# Altium project OPTICAL-FLOW-STM32.PrjPcb
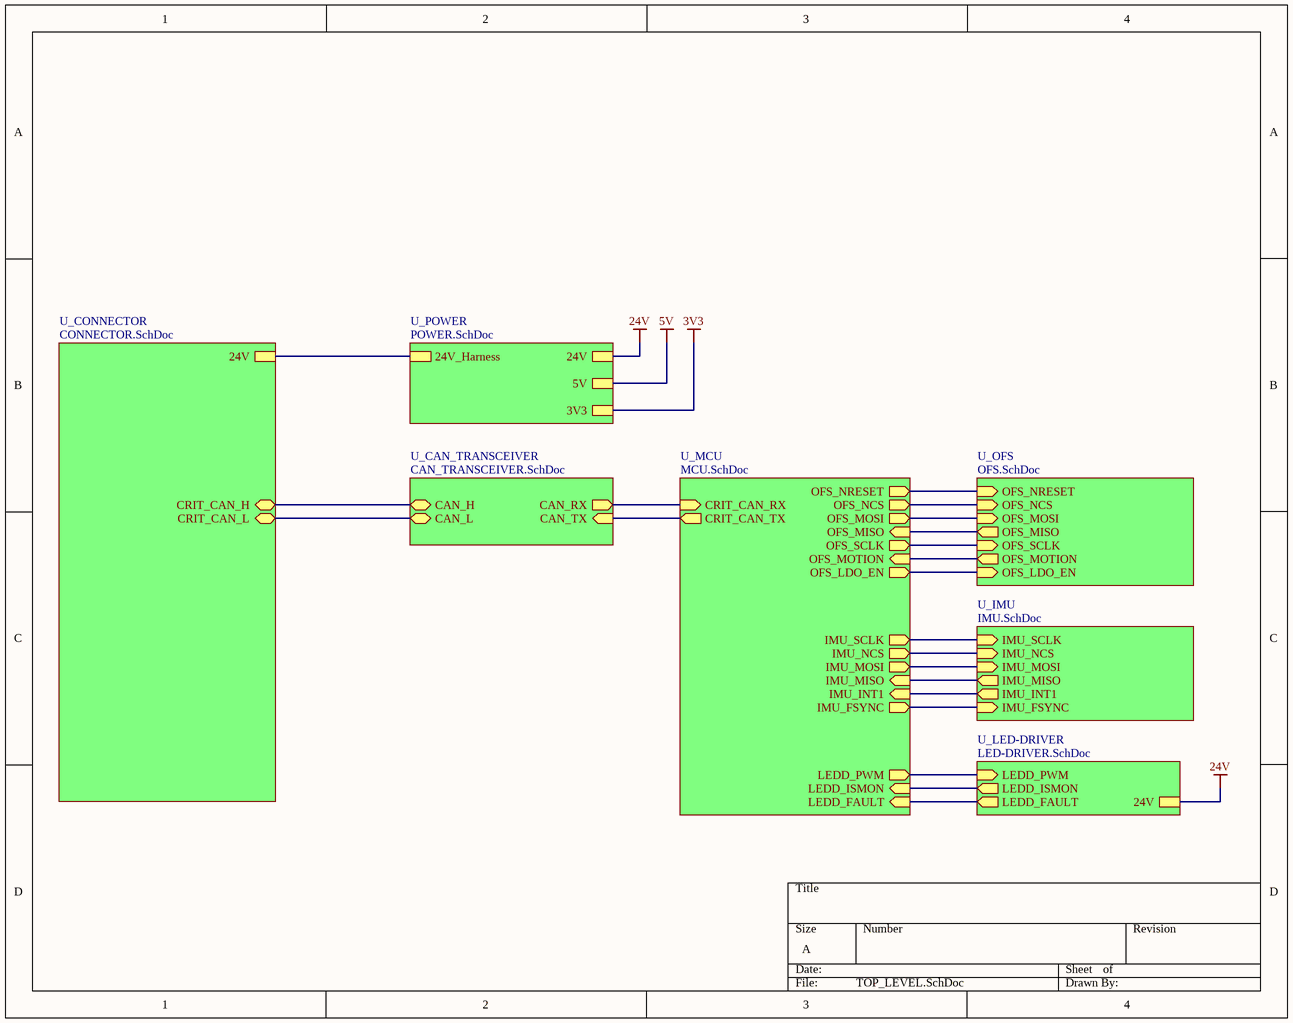
[diagram p0: TOP_LEVEL.SchDoc]
8 sheets, 89 parts. Net scope: hierarchical (ports join the sheet entries above them; power ports are global).
Board file: OFS_2027.PcbDoc
Sheets:
  TOP_LEVEL.SchDoc
    U_CAN_TRANSCEIVER = CAN_TRANSCEIVER.SchDoc
    U_POWER = POWER.SchDoc
    U_CONNECTOR = CONNECTOR.SchDoc
    U_MCU = MCU.SchDoc
    U_OFS = OFS.SchDoc
    U_IMU = IMU.SchDoc
    U_LED-DRIVER = LED-DRIVER.SchDoc

## Sheet TOP_LEVEL.SchDoc
size A; SheetNumber: 1; SheetTotal: 8

### Sub-sheets
U_CAN_TRANSCEIVER = CAN_TRANSCEIVER.SchDoc: CAN_TX (in), CAN_RX (out), CAN_L (bidir), CAN_H (bidir)
U_CONNECTOR = CONNECTOR.SchDoc: 24V, CRIT_CAN_L (bidir), CRIT_CAN_H (bidir)
U_IMU = IMU.SchDoc: IMU_SCLK (in), IMU_MOSI (in), IMU_MISO (out), IMU_INT1 (out), IMU_FSYNC (in), IMU_NCS (in)
U_LED-DRIVER = LED-DRIVER.SchDoc: LEDD_PWM (in), LEDD_ISMON (out), LEDD_FAULT (out), 24V
U_MCU = MCU.SchDoc: CRIT_CAN_RX (in), CRIT_CAN_TX (out), OFS_NRESET (out), OFS_NCS (out), OFS_MOSI (out), OFS_SCLK (out), OFS_MISO (in), OFS_MOTION (in), OFS_LDO_EN (out), IMU_SCLK (out), IMU_NCS (out), IMU_MOSI (out), IMU_MISO (in), IMU_INT1 (in), IMU_FSYNC (out), LEDD_PWM (out), LEDD_ISMON (in), LEDD_FAULT (in)
U_OFS = OFS.SchDoc: OFS_NRESET (in), OFS_NCS (in), OFS_MOSI (in), OFS_MOTION (out), OFS_LDO_EN (in), OFS_SCLK (in), OFS_MISO (out)
U_POWER = POWER.SchDoc: 24V, 24V_Harness, 5V, 3V3

### Nets
24V: sheet U_POWER/24V, sheet U_LED-DRIVER/24V
NetD3_2: sheet U_POWER/24V_Harness, sheet U_CONNECTOR/24V
NetR6_1: sheet U_MCU/OFS_MISO, sheet U_OFS/OFS_MISO
NetR7_2: sheet U_CAN_TRANSCEIVER/CAN_H, sheet U_CONNECTOR/CRIT_CAN_H
NetR8_1: sheet U_CAN_TRANSCEIVER/CAN_L, sheet U_CONNECTOR/CRIT_CAN_L
NetR?#6_1: sheet U_MCU/LEDD_PWM, sheet U_LED-DRIVER/LEDD_PWM
NetR?#8_1: sheet U_MCU/LEDD_FAULT, sheet U_LED-DRIVER/LEDD_FAULT
NetU1_4: sheet U_MCU/OFS_NCS, sheet U_OFS/OFS_NCS
NetU1_24: sheet U_MCU/LEDD_ISMON, sheet U_LED-DRIVER/LEDD_ISMON
NetU1_26: sheet U_MCU/OFS_MOTION, sheet U_OFS/OFS_MOTION
NetU1_27: sheet U_MCU/OFS_NRESET, sheet U_OFS/OFS_NRESET
NetU1_28: sheet U_MCU/OFS_LDO_EN, sheet U_OFS/OFS_LDO_EN
NetU1_29: sheet U_MCU/IMU_SCLK, sheet U_IMU/IMU_SCLK
NetU1_35: sheet U_MCU/IMU_MISO, sheet U_IMU/IMU_MISO
NetU1_36: sheet U_MCU/IMU_MOSI, sheet U_IMU/IMU_MOSI
NetU1_39: sheet U_MCU/IMU_FSYNC, sheet U_IMU/IMU_FSYNC
NetU1_44: sheet U_CAN_TRANSCEIVER/CAN_RX, sheet U_MCU/CRIT_CAN_RX
NetU1_45: sheet U_CAN_TRANSCEIVER/CAN_TX, sheet U_MCU/CRIT_CAN_TX
NetU1_51: sheet U_MCU/OFS_SCLK, sheet U_OFS/OFS_SCLK
NetU1_53: sheet U_MCU/OFS_MOSI, sheet U_OFS/OFS_MOSI
NetU1_55: sheet U_MCU/IMU_INT1, sheet U_IMU/IMU_INT1
NetU1_56: sheet U_MCU/IMU_NCS, sheet U_IMU/IMU_NCS

## Sheet CAN_TRANSCEIVER.SchDoc
size A; SheetNumber: 4; SheetTotal: 7
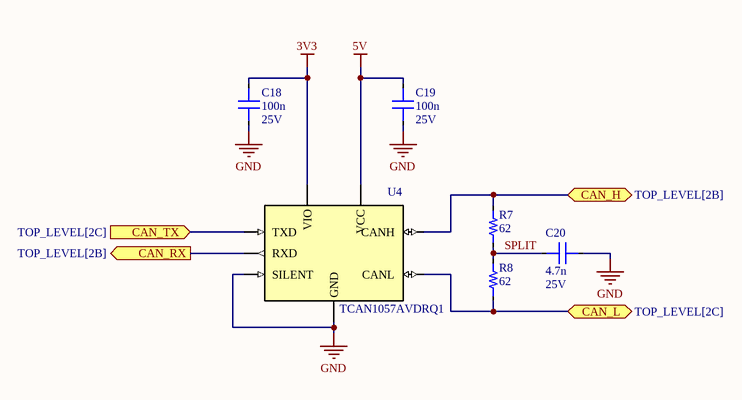
[diagram p1: CAN_TRANSCEIVER.SchDoc]

### Parts
C18  value 100n  Voltage: 25V  [0603_CAP]  (hidden comment: Capacitor)
C19  value 100n  Voltage: 25V  [0603_CAP]  (hidden comment: Capacitor)
C20  value 4.7n  Voltage: 25V  [0603_CAP]  (hidden comment: Capacitor)
R7  value 62  [0603_RES]  (hidden comment: Resistor)
R8  value 62  [0603_RES]  (hidden comment: Resistor)
U4  TCAN1057AVDRQ1  [SOIC8_D_TEX]

### Ports
CAN_H (bidir, see TOP_LEVEL[2B]), CAN_L (bidir, see TOP_LEVEL[2C]), CAN_RX (out, see TOP_LEVEL[2B]), CAN_TX (in, see TOP_LEVEL[2C])

### Nets
3V3: C18.2 U4.5(VIO)
5V: C19.2 U4.3(VCC)
GND: C18.1 C19.1 C20.2 U4.2(GND) U4.8(SILENT)
SPLIT: C20.1 R7.1 R8.2
NetR7_2: R7.2 U4.7(CANH) ; port CAN_H
NetR8_1: R8.1 U4.6(CANL) ; port CAN_L
NetU1_44: U4.4(RXD) ; port CAN_RX
NetU1_45: U4.1(TXD) ; port CAN_TX

### Library data of the parts
U4 = TCAN1057AVDRQ1: CAN transceiver with silent mode 8-SOIC Bus Protected; Manufacturer_Name: Texas Instruments; Type: Interface; Copyright: Copyright (C) 2025 Ultra Librarian. All rights reserved.; Manufacturer_Part_Number: TCAN1057AVDRQ1; RefDes: RefDes; ComponentLink1Description: Datasheet; ComponentLink1URL: https://www.ti.com/lit/ds/symlink/tcan1057a-q1.pdf
C18-C20 = Capacitor: Dielectric: *; Percent Tolerance: *; ESR: *
R7 R8 = Resistor: Tolerance: *

## Sheet POWER.SchDoc
size A4; SheetNumber: 5; SheetTotal: 8
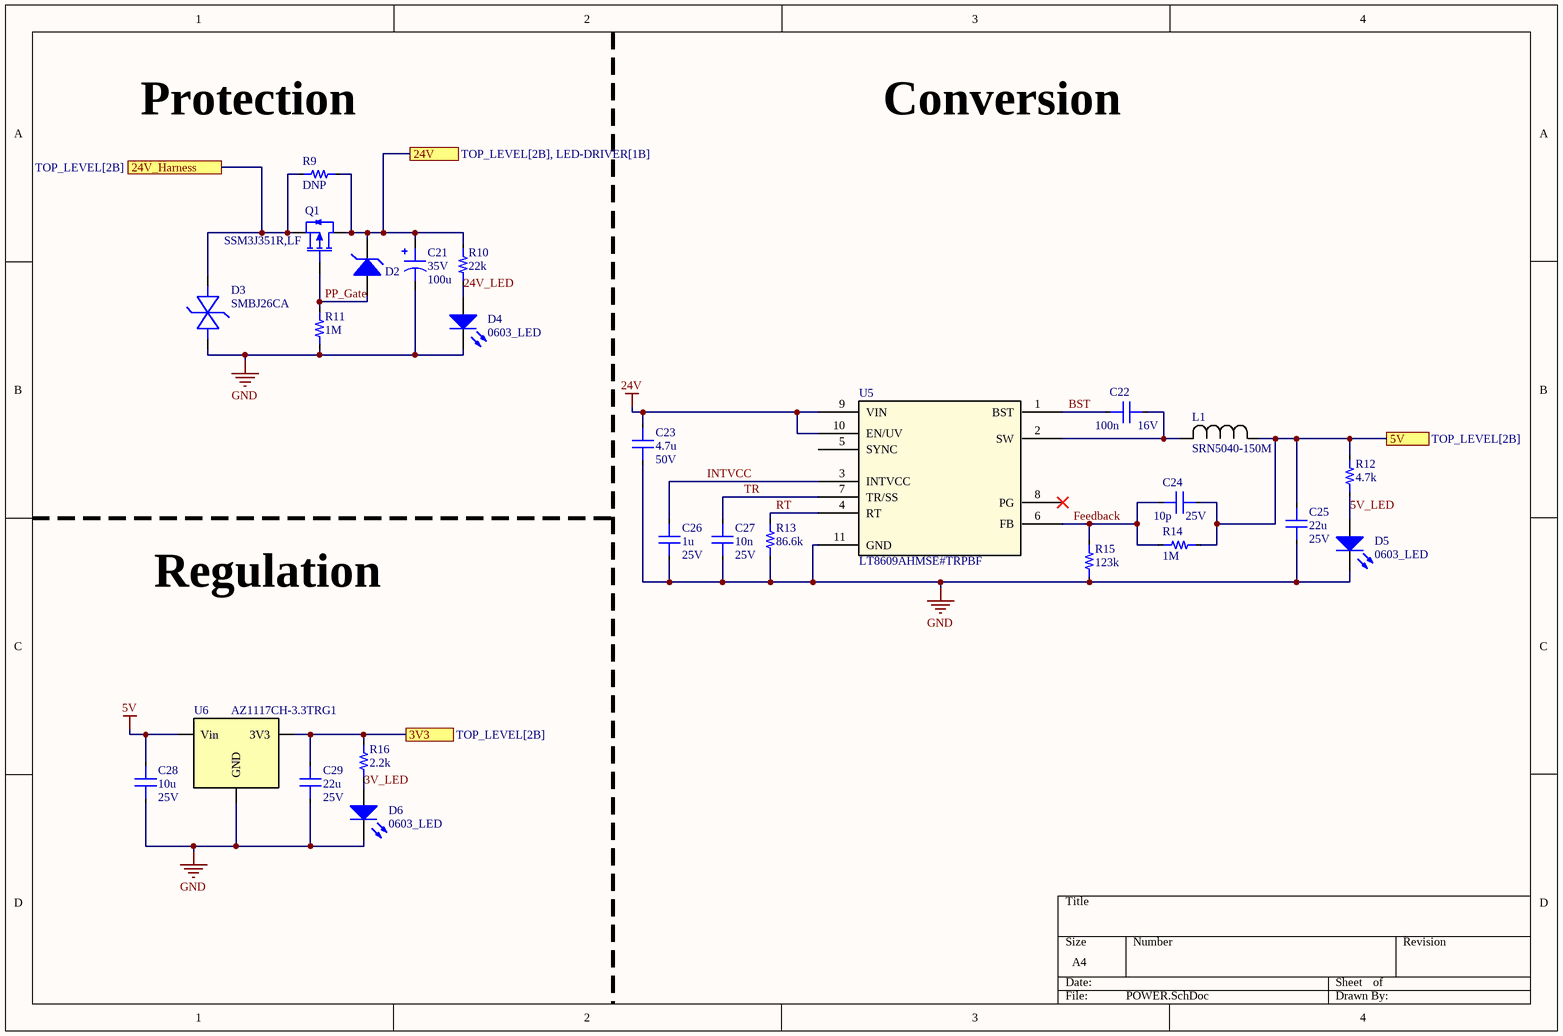
[diagram p2: POWER.SchDoc]

### Parts
C21  Voltage: 35V  Vaule: 100u  [6.60x6.60x8.00mm_E_CAP]  (hidden comment: 865080545012)
C22  value 100n  Voltage: 16V  [0603_CAP]  (hidden comment: Capacitor)
C23  value 4.7u  Voltage: 50V  [1206_CAP]  (hidden comment: Capacitor)
C24  value 10p  Voltage: 25V  [0603_CAP]  (hidden comment: Capacitor)
C25  value 22u  Voltage: 25V  [1206_CAP]  (hidden comment: Capacitor)
C26  value 1u  Voltage: 25V  [0603_CAP]  (hidden comment: Capacitor)
C27  value 10n  Voltage: 25V  [0603_CAP]  (hidden comment: Capacitor)
C28  value 10u  Voltage: 25V  [0603_CAP]  (hidden comment: Capacitor)
C29  value 22u  Voltage: 25V  [0603_CAP]  (hidden comment: Capacitor)
D2  MMSZ5231B-7-F  [SOD-123]  (value not drawn)
D3  SMBJ26CA  [SMBJ26CA]
D4  0603_LED  [0603_LED]
D5  0603_LED  [0603_LED]
D6  0603_LED  [0603_LED]
L1  SRN5040-150M  [SRN5040-150M]
Q1  SSM3J351R,LF  [SSM3J351R,LF]
R9  value DNP  [0603_RES]  (hidden comment: Resistor)
R10  value 22k  [0603_RES]  (hidden comment: Resistor)
R11  value 1M  [0603_RES]  (hidden comment: Resistor)
R12  value 4.7k  [0603_RES]  (hidden comment: Resistor)
R13  value 86.6k  [0603_RES]  (hidden comment: Resistor)
R14  value 1M  [0603_RES]  (hidden comment: Resistor)
R15  value 123k  [0603_RES]  (hidden comment: Resistor)
R16  value 2.2k  [0603_RES]  (hidden comment: Resistor)
U5  LT8609AHMSE#TRPBF  [05-08-1664_ADI]
U6  AZ1117CH-3.3TRG1  [SOT-233-4]

### Ports
3V3 (see TOP_LEVEL[2B]), 5V (see TOP_LEVEL[2B]), 24V (see TOP_LEVEL[2B], LED-DRIVER[1B]), 24V_Harness (see TOP_LEVEL[2B])

### Nets
3V3: C29.2 R16.2 U6.2,_4(3V3) ; port 3V3
5V: C24.2 C25.2 C28.2 L1.2 R12.2 R14.1 U6.3(Vin) ; port 5V
24V: C21.1 C23.2 D2.1(K) Q1.3(D) R9.2 R10.2 U5.9(VIN) U5.10(EN/UV) ; port 24V
GND: C21.2 C23.1 C25.1 C26.1 C27.1 C28.1 C29.1 D3.1 D4.1(C) D5.1(C) D6.1(C) R11.1 R13.1 R15.2 U5.11(GND) U6.1(GND)
3V_LED: D6.2(A) R16.1
5V_LED: D5.2(A) R12.1
24V_LED: D4.2(A) R10.1
BST: C22.2 U5.1(BST)
Feedback: C24.1 R14.2 R15.1 U5.6(FB)
INTVCC: C26.2 U5.3(INTVCC)
PP_Gate: D2.2(A) Q1.1(G) R11.2
RT: R13.2 U5.4(RT)
TR: C27.2 U5.7(TR/SS)
NetC22_1: C22.1 L1.1 U5.2(SW)
NetD3_2: D3.2 Q1.2(S) R9.1 ; port 24V_Harness

Not connected (* = marked no-connect by the designer): U5 5(SYNC) 8(PG)*

### Notes on the sheet
- (near R9) Protection
- Conversion
- Regulation

### Library data of the parts
C21 = 865080545012: CAP ALUM 100UF 20% 35V SMD; ComponentLink1Description: Digikey; ComponentLink1URL: https://www.digikey.com/en/products/detail/würth-elektronik/865080545012/5728106
D2 = MMSZ5231B-7-F: Zener Diode 5.1V 500mW ±5% Surface Mount SOD-123; Num_Circuits: 1; Package: SOD-123; ComponentLink1Description: Digikey; ComponentLink1URL: https://www.digikey.com/en/products/detail/diodes-incorporated/MMSZ5231B-7-F/755472
D3 = SMBJ26CA: 42.1V Clamp 14.3A Ipp Tvs Diode Surface Mount DO-214AA (SMBJ); ComponentLink1Description: Digikey; ComponentLink1URL: https://www.digikey.com/en/products/detail/littelfuse-inc/SMBJ26CA/286000
D4-D6 = 0603_LED: WL-SMCW Mono-color Chip LED Waterclear, SMT, size 0603, Blue, 3.2V, 140°; Manufacturer Part Number: 150060BS75000; Manufacturer: Wurth Elektronik; Case/Size Code: 0603; Chip Technology: InGaN; Dominant Wavelength: 470nm; Luminous Intensity: 145mcd; Peak Wavelength: 465nm; Category: Signal LEDs; Match Code: WL-SMCW; ComponentLink1Description: Website Link; ComponentLink1URL: https://www.we-online.com/redexpert/article/150060BS75000?ad; ComponentLink2Description: Datasheet Link; ComponentLink2URL: https://www.we-online.com/redexpert/spec/150060BS75000?ad; Mount: Surface Mount; Operating Temperature Max: 85°C; Operating Temperature Min: -40°C; Packaging: Tape and Reel; Length: 1.6mm; Width: 0.8mm; Height: 0.7mm; Emitting Color: Blue; Forward Voltage: 3.2V; Viewing Angle: 140°
L1 = SRN5040-150M: FIXED IND 15UH 1.8A 96 MOHM SMD
Q1 = SSM3J351R,LF: MOSFET P-CH 60V 3.5A SOT-23F
U5 = LT8609AHMSETRPBF: Buck Switching Regulator IC Positive Adjustable 0.782V 1 Output 3A 10-TFSOP, 10-MSOP (0.118", 3.00mm Width) Exposed Pad; Manufacturer_Name: Analog Devices Inc; Type: Power Management; Copyright: Copyright (C) 2025 Ultra Librarian. All rights reserved.; Manufacturer_Part_Number: LT8609AHMSE#TRPBF; RefDes: RefDes
U6 = AZ1117CH-3.3TRG1: No Description Available; Manufacturer_Name: Diodes Inc; Copyright: Copyright (C) 2025 Ultra Librarian. All rights reserved.; Manufacturer_Part_Number: AZ1117CH-3.3TRG1; RefDes: RefDes; Type: Type
C22-C29 = Capacitor: Dielectric: *; Percent Tolerance: *; ESR: *
R9-R16 = Resistor: Tolerance: *

## Sheet CONNECTOR.SchDoc
size A4; SheetNumber: 6; SheetTotal: 8
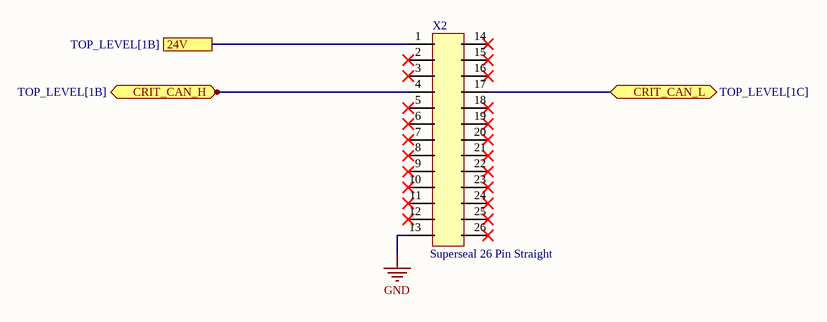
[diagram p3: CONNECTOR.SchDoc]

### Parts
X2  Superseal 26 Pin Straight  [SUPERSEAL-26Pin-STR]

### Ports
24V (see TOP_LEVEL[1B]), CRIT_CAN_H (bidir, see TOP_LEVEL[1B]), CRIT_CAN_L (bidir, see TOP_LEVEL[1C])

### Nets
GND: X2.13
NetD3_2: X2.1 ; port 24V
NetR7_2: X2.4 ; port CRIT_CAN_H
NetR8_1: X2.17 ; port CRIT_CAN_L

Not connected (* = marked no-connect by the designer): X2 2* 3* 5* 6* 7* 8* 9* 10* 11* 12* 14* 15* 16* 18* 19* 20* 21* 22* 23* 24* 25* 26*

### Library data of the parts
X2 = 6437288-6: Connector Header Through Hole 26 position 0.118" (3.00mm)

## Sheet MCU.SchDoc
size A4; SheetNumber: 2; SheetTotal: 8
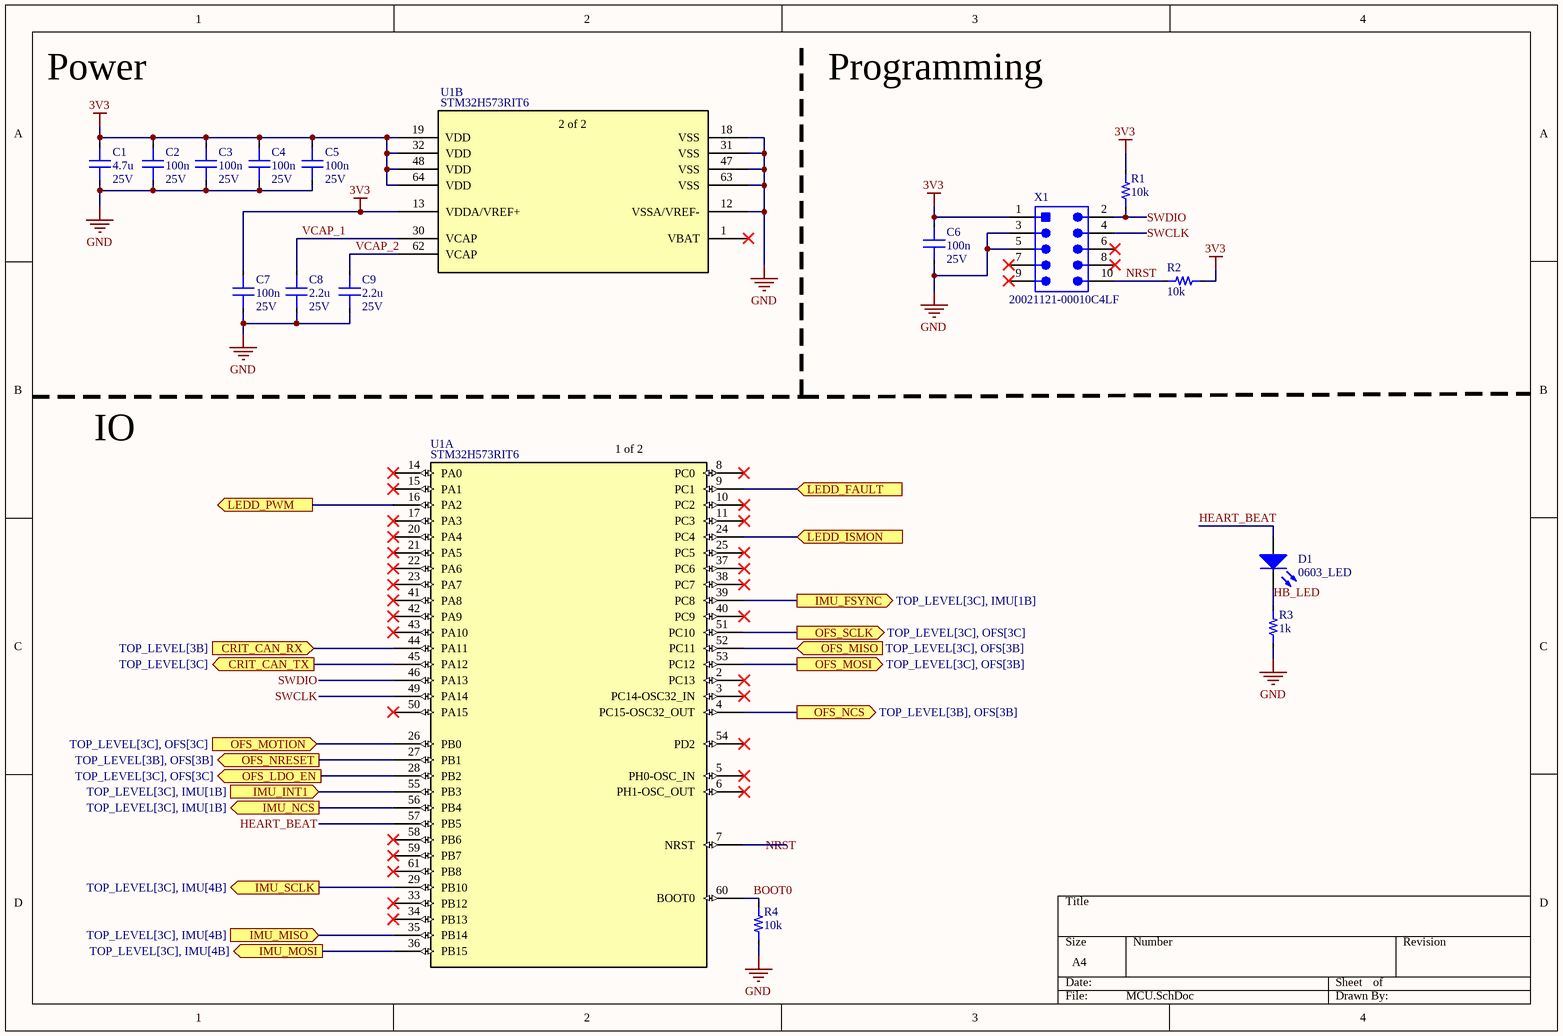
[diagram p4: MCU.SchDoc]

### Parts
C1  value 4.7u  Voltage: 25V  [0603_CAP]  (hidden comment: Capacitor)
C2  value 100n  Voltage: 25V  [0603_CAP]  (hidden comment: Capacitor)
C3  value 100n  Voltage: 25V  [0603_CAP]  (hidden comment: Capacitor)
C4  value 100n  Voltage: 25V  [0603_CAP]  (hidden comment: Capacitor)
C5  value 100n  Voltage: 25V  [0603_CAP]  (hidden comment: Capacitor)
C6  value 100n  Voltage: 25V  [0603_CAP]  (hidden comment: Capacitor)
C7  value 100n  Voltage: 25V  [0603_CAP]  (hidden comment: Capacitor)
C8  value 2.2u  Voltage: 25V  [0603_CAP]  (hidden comment: Capacitor)
C9  value 2.2u  Voltage: 25V  [0603_CAP]  (hidden comment: Capacitor)
D1  0603_LED  [0603_LED]
R1  value 10k  [0603_RES]  (hidden comment: Resistor)
R2  value 10k  [0603_RES]  (hidden comment: Resistor)
R3  value 1k  [0603_RES]  (hidden comment: Resistor)
R4  value 10k  [0603_RES]  (hidden comment: Resistor)
U1  STM32H573RIT6  [LQFP64-10x10mm_STM]  (parts A,B of 2)
X1  20021121-00010C4LF  [HDR2X5_SMT]

### Ports
CRIT_CAN_RX (in, see TOP_LEVEL[3B]), CRIT_CAN_TX (out, see TOP_LEVEL[3C]), IMU_FSYNC (out, see TOP_LEVEL[3C], IMU[1B]), IMU_INT1 (in, see TOP_LEVEL[3C], IMU[1B]), IMU_MISO (in, see TOP_LEVEL[3C], IMU[4B]), IMU_MOSI (out, see TOP_LEVEL[3C], IMU[4B]), IMU_NCS (out, see TOP_LEVEL[3C], IMU[1B]), IMU_SCLK (out, see TOP_LEVEL[3C], IMU[4B]), LEDD_FAULT (in), LEDD_ISMON (in), LEDD_PWM (out), OFS_LDO_EN (out, see TOP_LEVEL[3C], OFS[3C]), OFS_MISO (in, see TOP_LEVEL[3C], OFS[3B]), OFS_MOSI (out, see TOP_LEVEL[3C], OFS[3B]), OFS_MOTION (in, see TOP_LEVEL[3C], OFS[3C]), OFS_NCS (out, see TOP_LEVEL[3B], OFS[3B]), OFS_NRESET (out, see TOP_LEVEL[3B], OFS[3B]), OFS_SCLK (out, see TOP_LEVEL[3C], OFS[3C])

### Nets
3V3: C1.1 C2.1 C3.1 C4.1 C5.1 C6.1 C7.1 R1.1 R2.2 U1.13(VDDA/VREF+) U1.19(VDD) U1.32(VDD) U1.48(VDD) U1.64(VDD) X1.1
GND: C1.2 C2.2 C3.2 C4.2 C5.2 C6.2 C7.2 C8.2 C9.2 R3.1 R4.1 U1.12(VSSA/VREF-) U1.18(VSS) U1.31(VSS) U1.47(VSS) U1.63(VSS) X1.3 X1.5
BOOT0: R4.2 U1.60(BOOT0)
HB_LED: D1.1(C) R3.2
HEART_BEAT: D1.2(A) U1.57(PB5)
NRST: R2.1 U1.7(NRST) X1.10
SWCLK: U1.49(PA14) X1.4
SWDIO: R1.2 U1.46(PA13) X1.2
VCAP_1: C8.1 U1.30(VCAP)
VCAP_2: C9.1 U1.62(VCAP)
NetR6_1: U1.52(PC11) ; port OFS_MISO
NetR?#6_1: U1.16(PA2) ; port LEDD_PWM
NetR?#8_1: U1.9(PC1) ; port LEDD_FAULT
NetU1_4: U1.4(PC15-OSC32_OUT) ; port OFS_NCS
NetU1_24: U1.24(PC4) ; port LEDD_ISMON
NetU1_26: U1.26(PB0) ; port OFS_MOTION
NetU1_27: U1.27(PB1) ; port OFS_NRESET
NetU1_28: U1.28(PB2) ; port OFS_LDO_EN
NetU1_29: U1.29(PB10) ; port IMU_SCLK
NetU1_35: U1.35(PB14) ; port IMU_MISO
NetU1_36: U1.36(PB15) ; port IMU_MOSI
NetU1_39: U1.39(PC8) ; port IMU_FSYNC
NetU1_44: U1.44(PA11) ; port CRIT_CAN_RX
NetU1_45: U1.45(PA12) ; port CRIT_CAN_TX
NetU1_51: U1.51(PC10) ; port OFS_SCLK
NetU1_53: U1.53(PC12) ; port OFS_MOSI
NetU1_55: U1.55(PB3) ; port IMU_INT1
NetU1_56: U1.56(PB4) ; port IMU_NCS

Not connected (* = marked no-connect by the designer): U1 1(VBAT)* 2(PC13)* 3(PC14-OSC32_IN)* 5(PH0-OSC_IN)* 6(PH1-OSC_OUT)* 8(PC0)* 10(PC2)* 11(PC3)* 14(PA0)* 15(PA1)* 17(PA3)* 20(PA4)* 21(PA5)* 22(PA6)* 23(PA7)* 25(PC5)* 33(PB12)* 34(PB13)* 37(PC6)* 38(PC7)* 40(PC9)* 41(PA8)* 42(PA9)* 43(PA10)* 50(PA15)* 54(PD2)* 58(PB6)* 59(PB7)* 61(PB8)*; X1 6* 7* 8* 9*

### Notes on the sheet
- Power
- Programming
- IO
- (in symbol STM32H573RIT6, part A) 1 of 2
- (in symbol STM32H573RIT6, part B) 2 of 2

### Library data of the parts
D1 = 0603_LED: as D4 on sheet POWER; Category: Signal LEDs; Match Code: WL-SMCW; ComponentLink1Description: Website Link; ComponentLink1URL: https://www.we-online.com/redexpert/article/150060BS75000?ad; ComponentLink2Description: Datasheet Link; ComponentLink2URL: https://www.we-online.com/redexpert/spec/150060BS75000?ad; Mount: Surface Mount; Operating Temperature Max: 85°C; Operating Temperature Min: -40°C; Packaging: Tape and Reel; Length: 1.6mm; Width: 0.8mm; Height: 0.7mm; Emitting Color: Blue; Forward Voltage: 3.2V; Viewing Angle: 140°
U1 = STM32H573RIT6: Mfr_Name: STMicroelectronics; RefDes: RefDes; Type: Type
X1 = 20021121-00010C4LF: Header, 10-Leads, Body 3.43x6.35mm, Pitch 1.27mm; Circuits: 10; Name: 20021121-00010C4LF; ComponentLink1Description: Digikey; ComponentLink1URL: https://www.digikey.com/product-detail/en/amphenol-icc-fci/20021121-00010C4LF/609-3695-1-ND/2209147
C1-C9 = Capacitor: Dielectric: *; Percent Tolerance: *; ESR: *
R1-R4 = Resistor: Tolerance: *

## Sheet OFS.SchDoc
size A; SheetNumber: 3; SheetTotal: 8
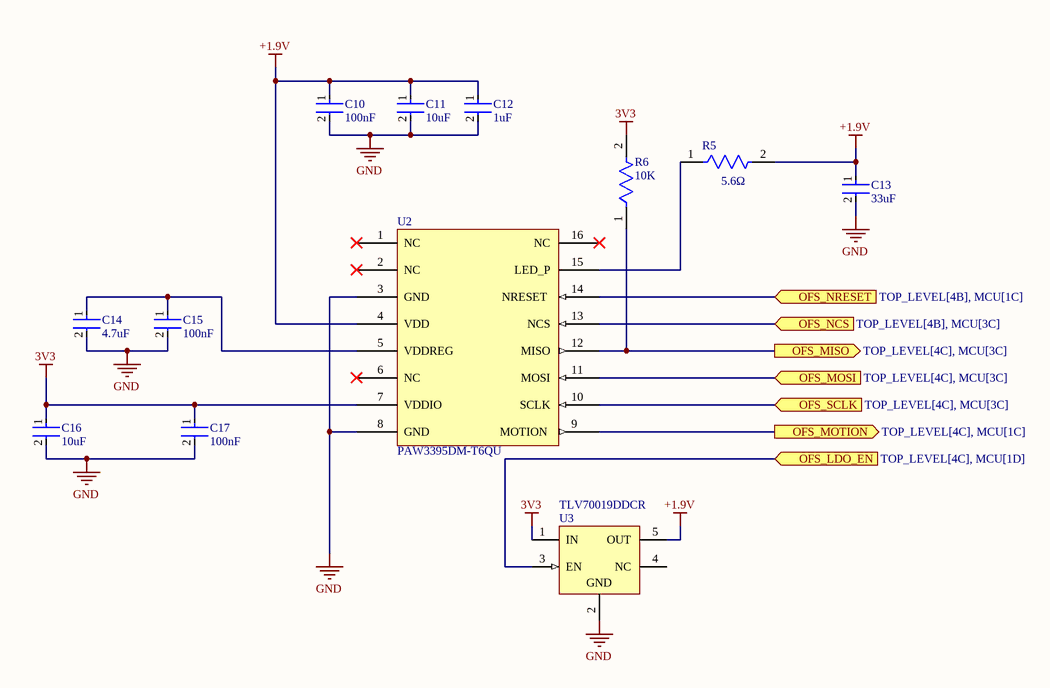
[diagram p5: OFS.SchDoc]

### Parts
C10  100nF  [FP-CL21-IPC_C]
C11  10uF  [FP-CL21-IPC_B]
C12  1uF  [FP-CL10B105KO8NNNC-MFG]
C13  33uF  [FP-C2012-125-0_2-IPC_A]
C14  4.7uF  [FP-CL21-IPC_A]
C15  100nF  [FP-CL21-IPC_C]
C16  10uF  [FP-CL21-IPC_B]
C17  100nF  [FP-CL21-IPC_C]
R5  5.6Ω  [FP-RMCF0603-IPC_A]
R6  10K  [FP-RMCF0805-MFG]
U2  PAW3395DM-T6QU  [PAW3395DM-T6QU]
U3  TLV70019DDCR  [DDC0005A_L]

### Ports
OFS_LDO_EN (in, see TOP_LEVEL[4C], MCU[1D]), OFS_MISO (out, see TOP_LEVEL[4C], MCU[3C]), OFS_MOSI (in, see TOP_LEVEL[4C], MCU[3C]), OFS_MOTION (out, see TOP_LEVEL[4C], MCU[1C]), OFS_NCS (in, see TOP_LEVEL[4B], MCU[3C]), OFS_NRESET (in, see TOP_LEVEL[4B], MCU[1C]), OFS_SCLK (in, see TOP_LEVEL[4C], MCU[3C])

### Nets
3V3: C16.1 C17.1 R6.2 U2.7(VDDIO) U3.1(IN)
+1.9V: C10.1 C11.1 C12.1 C13.1 R5.2 U2.4(VDD) U3.5(OUT)
GND: C10.2 C11.2 C12.2 C13.2 C14.2 C15.2 C16.2 C17.2 U2.3(GND) U2.8(GND) U3.2(GND)
NetC14_1: C14.1 C15.1 U2.5(VDDREG)
NetR5_1: R5.1 U2.15(LED_P)
NetR6_1: R6.1 U2.12(MISO) ; port OFS_MISO
NetU1_4: U2.13(NCS) ; port OFS_NCS
NetU1_26: U2.9(MOTION) ; port OFS_MOTION
NetU1_27: U2.14(NRESET) ; port OFS_NRESET
NetU1_28: U3.3(EN) ; port OFS_LDO_EN
NetU1_51: U2.10(SCLK) ; port OFS_SCLK
NetU1_53: U2.11(MOSI) ; port OFS_MOSI

Not connected (* = marked no-connect by the designer): U2 1(NC)* 2(NC)* 6(NC)* 16(NC)*; U3 4(NC)

### Library data of the parts
C10 C15 C17 = CMP-2000-05017-2: CL21 Series 0805 100nF 50V ±10% Tolerance X7R Multilayer Ceramic Chip Capacitor; Depth: 1.25mm; Height: 0.85mm; Width: 0.049inch; Tolerance: 10%; Case Code (Metric): 2012; Case Code (Imperial): 0805; Material: Ceramic; Thickness: 0.037inch; Min Operating Temperature: -55°C; Contact Plating: Tin; Length: 2mm; Mount: Surface Mount; Voltage Rating (DC): 50V; Lead Free: Lead Free; Dielectric: X7R; Radiation Hardening: No; Capacitance: 100nF; Voltage Rating: 50V; Case/Package: 0805; Packaging: Tape and Reel; Max Operating Temperature: 125°C; Voltage: 50V
C11 C16 = CMP-13271-001796-1: CL21 Series 0805 10uF 10V ±10% Tolerance X5R Multilayer Ceramic Chip Capacitor; Lead Free: Lead Free; Packaging: Tape and Reel; Capacitance: 10uF; Case Code (Imperial): 0805; Length: 2mm; Thickness: 0.053inch; Depth: 1.25mm; Mount: Surface Mount; Voltage: 10V; Case/Package: 0805; Dielectric: X5R; Height: 1.25mm; Voltage Rating: 10V; Radiation Hardening: No; Tolerance: 10%; Package Quantity: 3000; Min Operating Temperature: -55°C; Case Code (Metric): 2012; Width: 0.049inch; Max Operating Temperature: 85°C; Termination: Wraparound
C12 = CMP-2000-06093-2: CAP CER 1UF 16V X7R 0603; Manufacturer: Samsung Electro-Mechanics America, Inc; Manufacturer Part Number: CL10B105KO8NNNC; Temperature Coefficient: 15%; Material: Ceramic; Tolerance: 10%; Voltage Rating: 16V; Automotive: No; ComponentLink2Description: Datasheet; Device Class L3: Ceramic Capacitors; Capacitance: 1uF; Temperature Characteristic: X7R; Temperature Range High: +125°C; Digikey Description: CAP CER 1UF 16V X7R 0603; Device Class L2: Capacitors; Octopart: https://octopart.com/cl10b105ko8nnnc-samsung-19018973; ComponentLink2URL: http://www.samsungsem.com/global/front/downloadcms.do?path=%2F%2Fglobal%2F%2Fsupport%2F%2Fproduct-search%2F%2Fmlcc%2F%2F__icsFiles%2F%2Fafieldfile%2F%2F2019%2F%2F06%2F%2F18&fileName=CL10B105KO8NNNC-19.pdf; Lead Free: Yes; Height: 0.9mm; Package: CL10B105KO8NNNC; Temperature Range Low: -55°C; Value: 1uF; Device Class L1: Passive Components; RoHS: TRUE; Temperature: -55°C to +125°C; Category: Cap; Ipc Land Pattern Name: CAPC16080X80
C13 = CMP-08246-003796-1: Multilayer Ceramic Capacitors 33μF ±20% 6.3V X5R SMD 0805; Series: C; Capacitance: 33uF; Min Operating Temperature: -55°C; Depth: 1.25mm; Radiation Hardening: No; Package Quantity: 1; Height: 1.25mm; Max Operating Temperature: 85°C; REACH SVHC: No SVHC; Mount: Surface Mount; Construction: Flat; Case/Package: 0805; Dielectric Material: Ceramic; Thickness: 0.057inch; Case Code (Imperial): 0805; Lead Free: Lead Free; Weight: 0.000194oz; Case Code (Metric): 2012; Tolerance: 20%; Dielectric: X5R; RoHS Compliant: Yes; Length: 2mm; Packaging: Tape and Reel; Voltage Rating (DC): 6.3V; Width: 1.2mm; Resistor Type: Ceramic; Termination: SMD/SMT; Voltage Rating: 6.3V
C14 = CMP-13271-002624-1: CL21 Series 0805 4.7uF 25V ±10% Tolerance X5R Multilayer Ceramic Chip Capacitor; Case Code (Imperial): 0805; Thickness: 0.055inch; Mount: Surface Mount; Case Code (Metric): 2012; Capacitance: 4.7uF; Depth: 1.25mm; Lead Free: Lead Free; Case/Package: 0805; Voltage Rating: 25V; Package Quantity: 1; Width: 0.049inch; Radiation Hardening: No; Voltage Rating (DC): 25V; Length: 2mm; Dielectric: X5R; Height: 1.25mm; Packaging: Tape and Reel; Tolerance: 10%; Min Operating Temperature: -55°C; Max Operating Temperature: 85°C
R5 = CMP-26527-007122-1: 5.6Ω ±1% 0.1W 0603 Thick Film Chip Resistor AEC-Q200 compliant; Resistance: 5.6R; Max Power Dissipation: 100mW; Temperature Coefficient: 200ppm/°C; Tolerance: 1%; Case/Package: 0603; Max Operating Temperature: 155°C; Radiation Hardening: No; Length: 0.061inch; Mount: Surface Mount; Series: RMCF; Contact Plating: Tin; Packaging: Tape and Reel; Number of Terminations: 2; Min Operating Temperature: -55°C; Height: 0.022inch; Case Code (Imperial): 0603; RoHS Compliant: Yes; Case Code (Metric): 1608; Resistor Type: Thick Film; Features: Automotive AEC-Q200; Width: 0.031inch
R6 = CMP-26527-000121-1: RES 10K OHM 1% 1/8W 0805; Power Rating: 125mW; Resistance: 10kR; Temperature Coefficient: 100ppm/°C; Depth: 1.25mm; Construction: Rectangular; Packaging: Tape and Reel; Tolerance: 1%; Lead Free: Lead Free; Case/Package: 0805; RoHS Compliant: Yes; Series: RMCF; Width: 0.049inch; Max Power Dissipation: 125mW; Contact Plating: Tin; Height: 0.026inch; Mount: Surface Mount; Resistor Type: Thick Film; Size Code: 0805; Length: 2mm; Max Operating Temperature: 155°C; Features: Automotive AEC-Q200; Radiation Hardening: No; Case Code (Imperial): 0805; Min Operating Temperature: -55°C; Case Code (Metric): 2012; Number of Terminations: 2; Military Standard: Not
U2 = PAW3395DM-T6QU: PixArt PAW3395DM-T6QU optical navigation sensor, 16-pin molded lead-frame DIP, 1.78mm pitch staggered dual row, 10.7mm row spacing, through-hole
U3 = CMP-0394-01054-2: Single Output LDO, 200 mA, Fixed 1.9 V Output, 2 to 5.5 V Input, with Low IQ, 5-pin SOT (DDC), -40 to 125 degC, Green (RoHS & no Sb/Br); Manufacturer: Texas Instruments; Iq(Typ)(mA): 0.03; Vin(Max)(V): 5.5; Accuracy(%): 2; Vout Adj(Min)(V): 1.9; Iout(Max)(A): 0.2; SubFamily: Single Channel LDO; Vdo(Typ)(mV): 175; ComponentLink2Description: Datasheet; PackageReference: DDC0005A; DatasheetVersion: SLVSA00D; ComponentLink3Description: Package Specification; ComponentLink2URL: http://www.ti.com/general/docs/lit/getliterature.tsp?genericPartNumber=TLV70019&fileType=pdf; PartNumber: TLV70019DDCR; PackageVersion: 4204403-2/E; Code_JEDEC: MO-193; ComponentLink1URL: http://www.ti.com/; Eco-Plan: Green (RoHS & no Sb/Br); PackageDescription: 5-Pin Plastic Small Outline, Body 2.9 x 1.6 mm, 0.95 mm Pitch; Fixed Output Options(V): 1.9; Vout Adj(Max)(V): 1.9; Vin(Min)(V): 2; Mounting Technology: Surface Mount; ComponentLink1Description: Manufacturer URL; ComponentLink3URL: http://www.ti.com/litv/pdf/mpds123d

## Sheet IMU.SchDoc
size A; SheetNumber: 7; SheetTotal: 8
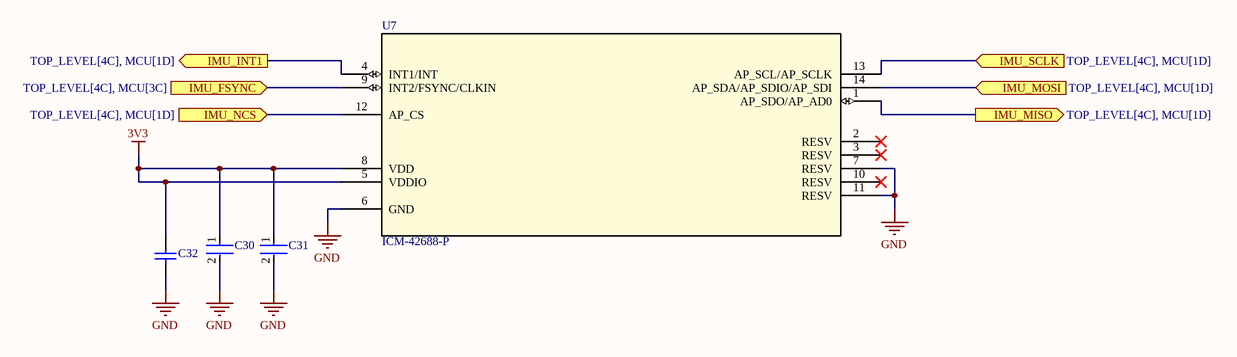
[diagram p6: IMU.SchDoc]

### Parts
C30  GRM21BD72A225ME01K  [FP-GRM21B-0_2-e0_2_0_7-IPC_B]  (value not drawn)
C31  CL21B104KBCNNNC  [FP-CL21-IPC_C]  (value not drawn)
C32  CL21B103KBANNNC  [CAPC2013X75X45LL10T25]  (value not drawn)
U7  ICM-42688-P  [LGA14_2P5X3X0P91_TDK]

### Ports
IMU_FSYNC (in, see TOP_LEVEL[4C], MCU[3C]), IMU_INT1 (out, see TOP_LEVEL[4C], MCU[1D]), IMU_MISO (out, see TOP_LEVEL[4C], MCU[1D]), IMU_MOSI (in, see TOP_LEVEL[4C], MCU[1D]), IMU_NCS (in, see TOP_LEVEL[4C], MCU[1D]), IMU_SCLK (in, see TOP_LEVEL[4C], MCU[1D])

### Nets
3V3: C30.1 C31.1 C32.2 U7.5(VDDIO) U7.8(VDD)
GND: C30.2 C31.2 C32.1 U7.6(GND) U7.7(RESV) U7.11(RESV)
NetU1_29: U7.13(AP_SCL/AP_SCLK) ; port IMU_SCLK
NetU1_35: U7.1(AP_SDO/AP_AD0) ; port IMU_MISO
NetU1_36: U7.14(AP_SDA/AP_SDIO/AP_SDI) ; port IMU_MOSI
NetU1_39: U7.9(INT2/FSYNC/CLKIN) ; port IMU_FSYNC
NetU1_55: U7.4(INT1/INT) ; port IMU_INT1
NetU1_56: U7.12(AP_CS) ; port IMU_NCS

Not connected (* = marked no-connect by the designer): U7 2(RESV)* 3(RESV)* 10(RESV)*

### Library data of the parts
C30 = CMP-06035-063309-1: CAP CER 2.2UF 100V X7T 0805
C31 = CMP-2000-05017-2: as C10 on sheet OFS; Depth: 1.25mm; Height: 0.85mm; Width: 0.049inch; Tolerance: 10%; Case Code (Metric): 2012; Case Code (Imperial): 0805; Material: Ceramic; Thickness: 0.037inch; Min Operating Temperature: -55°C; Contact Plating: Tin; Length: 2mm; Mount: Surface Mount; Voltage Rating (DC): 50V; Lead Free: Lead Free; Dielectric: X7R; Radiation Hardening: No; Capacitance: 100nF; Voltage Rating: 50V; Case/Package: 0805; Packaging: Tape and Reel; Max Operating Temperature: 125°C; Voltage: 50V
C32 = CMP-2000-06105-1: Multilayer Ceramic Capacitor, 10 nF, 50 V, -55 to 125 degC, 2-Pin SMD, RoHS, Tape and Reel; Manufacturer: Samsung Electro-Mechanics; Capacitance: 10000pF; Tolerance (%): ±10%; Dielectric: X7R; Rated Voltage: 50V; Package Description: 2-Pin Surface Mount Device, Body 2 x 1.25 mm; Datasheet Version: 11/2010; Package Reference: 0805; Case Size/Dimension: 0805; Datasheet URL: https://datasheet.ciiva.com/29199/455082-da-01-en-vs-kondensator-0805-29199459.pdf; Mounting Technology: SurfaceMount; Manufacturer URL: http://www.samsungsem.com/global/index.jsp
U7 = ICM-42688-P: Description; Manufacturer_Name: TDK; Type: Motion Sensors; Copyright: Copyright (C) 2025 Ultra Librarian. All rights reserved.; Manufacturer_Part_Number: ICM-42688-P; RefDes: RefDes

## Sheet LED-DRIVER.SchDoc
size A4; SheetNumber: 8; SheetTotal: 8
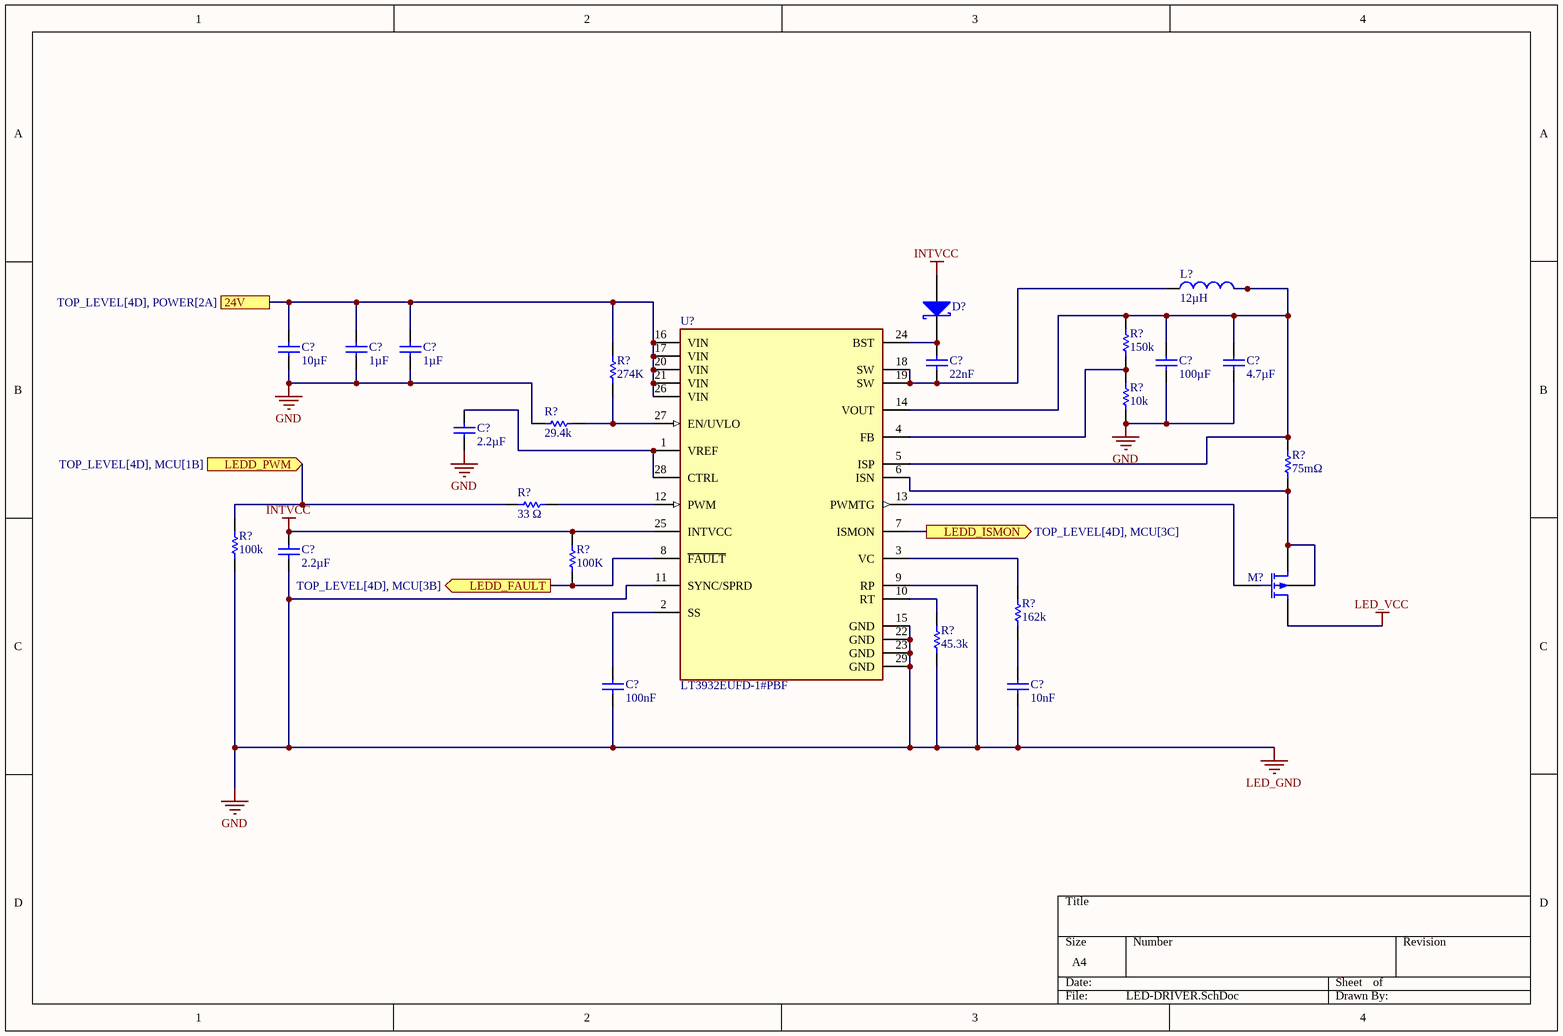
[diagram p7: LED-DRIVER.SchDoc]

### Parts
(Parts that share a designator on the sheet are numbered #1, #2 ... from top to bottom, then left to right.)
C?#1  value 10µF  (hidden comment: Capacitor)
C?#2  value 1µF  (hidden comment: Capacitor)
C?#3  value 1µF  (hidden comment: Capacitor)
C?#4  value 22nF  (hidden comment: Capacitor)
C?#5  value 100µF  (hidden comment: Capacitor)
C?#6  value 4.7µF  (hidden comment: Capacitor)
C?#7  value 2.2µF  (hidden comment: Capacitor)
C?#8  value 2.2µF  (hidden comment: Capacitor)
C?#9  value 100nF  (hidden comment: Capacitor)
C?#10  value 10nF  (hidden comment: Capacitor)
D?  BAT46WJ,115  (value not drawn)
L?  value 12µH  (hidden comment: Inductor)
M?  DMP3045LFVWQ-7  (value not drawn)
R?#1  value 150k  (hidden comment: Resistor)
R?#2  value 274K  (hidden comment: Resistor)
R?#3  value 29.4k  (hidden comment: Resistor)
R?#4  value 10k  (hidden comment: Resistor)
R?#5  value 75mΩ  (hidden comment: Resistor)
R?#6  value 33 Ω  (hidden comment: Resistor)
R?#7  value 100k  (hidden comment: Resistor)
R?#8  value 100K  (hidden comment: Resistor)
R?#9  value 162k  (hidden comment: Resistor)
R?#10  value 45.3k  (hidden comment: Resistor)
U?  LT3932EUFD-1#PBF  [FP-UFD-28-05-08-1712-IPC_C]

### Ports
24V (see TOP_LEVEL[4D], POWER[2A]), LEDD_FAULT (out, see TOP_LEVEL[4D], MCU[3B]), LEDD_ISMON (out, see TOP_LEVEL[4D], MCU[3C]), LEDD_PWM (in, see TOP_LEVEL[4D], MCU[1B])

### Nets
24V: C?#1.1 C?#2.1 C?#3.1 R?#2.2 U?.16(VIN) U?.17(VIN) U?.20(VIN) U?.21(VIN) U?.26(VIN) ; port 24V
GND: C?#1.2 C?#2.2 C?#3.2 C?#5.2 C?#6.2 C?#7.2 C?#8.2 C?#9.2 C?#10.2 R?#3.2 R?#4.1 R?#7.2 R?#10.1 U?.9(RP) U?.11(SYNC/SPRD) U?.15(GND) U?.22(GND) U?.23(GND) U?.29(GND)  [also labelled LED_GND]
INTVCC: C?#8.1 D?.1(A) R?#8.2 U?.25(INTVCC)
LED_VCC: M?.3(S)
NetC?#4_1: C?#4.1 D?.2(K) U?.24(BST)
NetC?#4_2: C?#4.2 L?.1 U?.18(SW) U?.19(SW)
NetC?#5_1: C?#5.1 C?#6.1 L?.2 R?#1.2 R?#5.2 U?.5(ISP) U?.14(VOUT)
NetC?#7_1: C?#7.1 U?.1(VREF) U?.28(CTRL)
NetC?#9_1: C?#9.1 U?.2(SS)
NetC?#10_1: C?#10.1 R?#9.1
NetM?_1: M?.1(D) M?.4(B) R?#5.1 U?.6(ISN)
NetM?_2: M?.2(G) U?.13(PWMTG)
NetR?#1_1: R?#1.1 R?#4.2 U?.4(FB)
NetR?#2_1: R?#2.1 R?#3.1 U?.27(EN/UVLO)
NetR?#6_1: R?#6.1 R?#7.1 ; port LEDD_PWM
NetR?#6_2: R?#6.2 U?.12(PWM)
NetR?#8_1: R?#8.1 U?.8(~{FAULT}) ; port LEDD_FAULT
NetR?#9_2: R?#9.2 U?.3(VC)
NetR?#10_2: R?#10.2 U?.10(RT)
NetU1_24: U?.7(ISMON) ; port LEDD_ISMON

### Library data of the parts
C?#1-C?#10 = Capacitor: SimulationGenericComponent: True
D? = Schottky Diode: AF: 1; BV: 0; BV_MAX: 1e99; EG: 1.11; FC: 0.5; IBV: 0.001; IS: 1e-14; MJSW: 0.33; NTUN: 30; TNOM: 27; XTI: 3; SimulationGenericComponent: True; CJO: 0; CJP: 0; CTA: 0; CTP: 0; FCS: 0.5; FV_MAX: 1e99; IKF: 0; IKR: 0; ISR: 1e-14; JSW: 0; JTUN: 0; JTUNSW: 0; KEG: 1; KF: 0; LEVEL: 1; N: 1; NBV: 1; NR: 1; NS: 1; PHP: 1; RS: 0; TCV: 0; TLEV: 0; TLEVC: 0; TM1: 0; TM2: 0; TPB: 0; TPHP: 0; TRS: 0; TRS2: 0; TT: 0; TTT1: 0; TTT2: 0; VJ: 1; XTITUN: 3
L? = Inductor: SimulationGenericComponent: True
M? = MOSFET P-ch Lev1: P-channel MOS1 MOSFET Shichman and Hodges Model; CBD: 0; FC: 0.5; IS: 1e-14; KP: 2e-05; PB: 0.8; PHI: 0.6; TNOM: 27; SimulationGenericComponent: True; CBS: 0; CGBO: 0; CGDO: 0; CGSO: 0; CJ: 0; CJSW: 0; GAMMA: 0; JS: 0; LAMBDA: 0; LD: 0; MJ: 0.5; MJSW: 0.5; NSS: 0; NSUB: 0; RD: 0; RS: 0; RSH: 0; TOX: 0; TPG: 0; U0: 0; VTO: 0
R?#1-R?#10 = Resistor: TC1: 0; SimulationGenericComponent: True; TC2: 0
U? = CMP-09135-000017-1: 40V, 2A MONOLITHIC SYNCHRONOUS S; RoHS Compliant: Yes

## Nets that join several sheets
3V3: CAN_TRANSCEIVER (C18.2 U4.5), POWER (C29.2 R16.2 U6.2, 4), MCU (15 pins), OFS (5 pins), IMU (5 pins)
5V: CAN_TRANSCEIVER (C19.2 U4.3), POWER (7 pins)
24V: POWER (8 pins), LED-DRIVER (9 pins)
GND: CAN_TRANSCEIVER (5 pins), POWER (16 pins), CONNECTOR (X2.13), MCU (18 pins), OFS (11 pins), IMU (6 pins), LED-DRIVER (19 pins)
NetD3_2: POWER (D3.2 Q1.2 R9.1), CONNECTOR (X2.1)
NetR6_1: MCU (U1.52), OFS (R6.1 U2.12)
NetR7_2: CAN_TRANSCEIVER (R7.2 U4.7), CONNECTOR (X2.4)
NetR8_1: CAN_TRANSCEIVER (R8.1 U4.6), CONNECTOR (X2.17)
NetR?#6_1: MCU (U1.16), LED-DRIVER (R?#6.1 R?#7.1)
NetR?#8_1: MCU (U1.9), LED-DRIVER (R?#8.1 U?.8)
NetU1_4: MCU (U1.4), OFS (U2.13)
NetU1_24: MCU (U1.24), LED-DRIVER (U?.7)
NetU1_26: MCU (U1.26), OFS (U2.9)
NetU1_27: MCU (U1.27), OFS (U2.14)
NetU1_28: MCU (U1.28), OFS (U3.3)
NetU1_29: MCU (U1.29), IMU (U7.13)
NetU1_35: MCU (U1.35), IMU (U7.1)
NetU1_36: MCU (U1.36), IMU (U7.14)
NetU1_39: MCU (U1.39), IMU (U7.9)
NetU1_44: CAN_TRANSCEIVER (U4.4), MCU (U1.44)
NetU1_45: CAN_TRANSCEIVER (U4.1), MCU (U1.45)
NetU1_51: MCU (U1.51), OFS (U2.10)
NetU1_53: MCU (U1.53), OFS (U2.11)
NetU1_55: MCU (U1.55), IMU (U7.4)
NetU1_56: MCU (U1.56), IMU (U7.12)